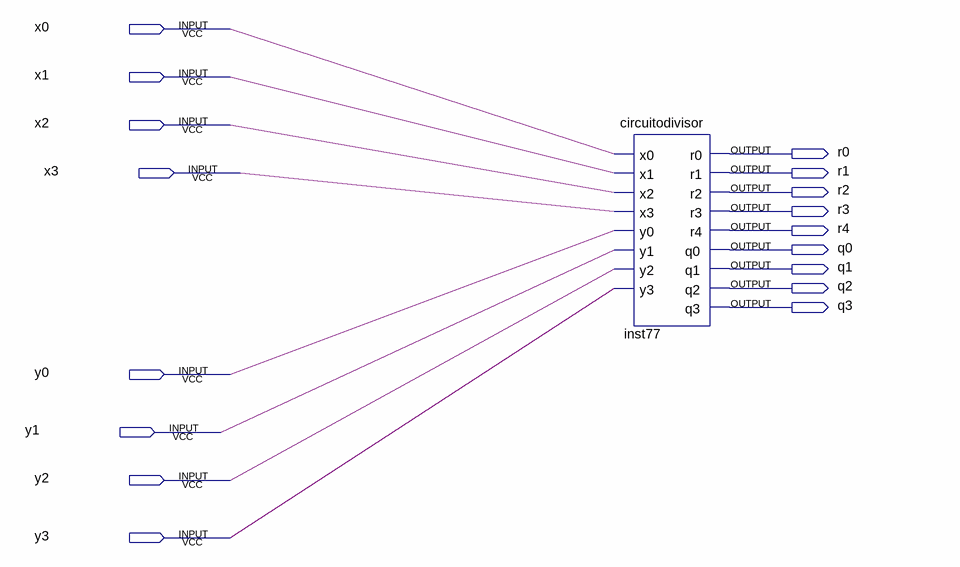
[diagram p0: schematic sheet]
// Quartus schematic divisor.bdf as structural Verilog: 1 symbols, 17 pins
module divisor (
  input  x0,
  input  x1,
  input  x2,
  input  x3,
  input  y0,
  input  y1,
  input  y2,
  input  y3,
  output r0,
  output r1,
  output r2,
  output r3,
  output r4,
  output q0,
  output q1,
  output q2,
  output q3
);

  circuitodivisor inst77 (
    .x0(x0), .x1(x1), .x2(x2), .x3(x3), .y0(y0), .y1(y1), .y2(y2), .y3(y3), .r0(r0), .r1(r1), .r2(r2),
    .r3(r3), .r4(r4), .q0(q0), .q1(q1), .q2(q2), .q3(q3));
endmodule
